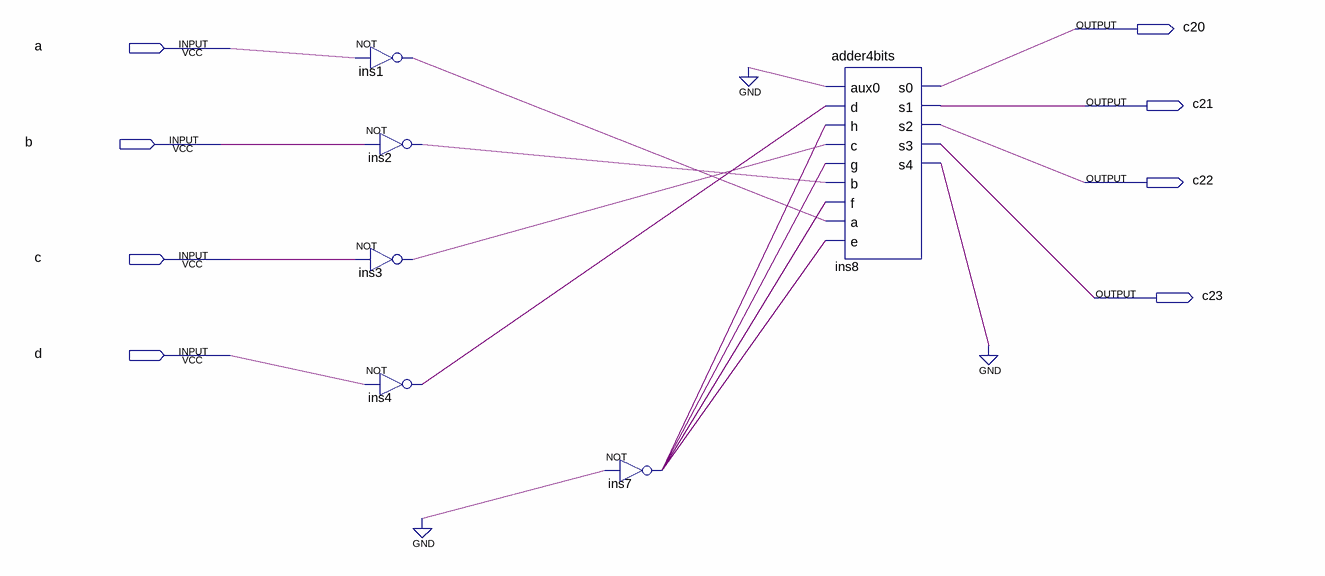
[diagram p0: schematic sheet]
// Quartus schematic comp2.bdf as structural Verilog: 6 symbols, 8 pins
module comp2 (
  input  a,
  input  b,
  input  c,
  input  d,
  output c20,
  output c21,
  output c22,
  output c23
);

  wire ins1_out, ins2_out, ins3_out, ins4_out, ins7_out, ins8_s4;

  not ins1 (ins1_out, a);
  not ins2 (ins2_out, b);
  not ins3 (ins3_out, c);
  not ins4 (ins4_out, d);
  not ins7 (ins7_out, 1'b0);
  adder4bits ins8 (
    .aux0(1'b0), .d(ins4_out), .h(ins7_out), .c(ins3_out), .g(ins7_out), .b(ins2_out), .f(ins7_out),
    .a(ins1_out), .e(ins7_out), .s0(c20), .s1(c21), .s2(c22), .s3(c23), .s4(ins8_s4));
  // also tied to GND on the sheet: ins8_s4
endmodule
